# Altium project LoRaWAN-Module-v2.0.PrjPcb
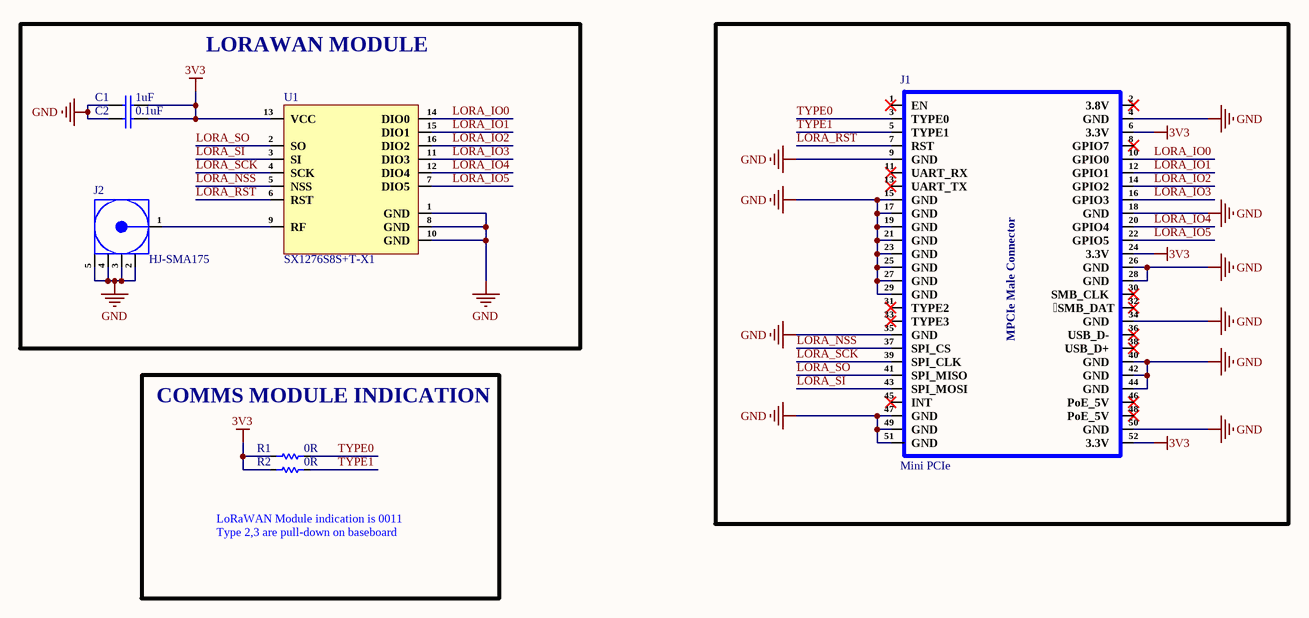
[diagram p0: LoRaWAN-Sheet.SchDoc]
1 sheet, 7 parts. Net scope: global (net labels, ports and power ports of the same name join across sheets).
Board file: LoRaWAN_v2.0.PcbDoc

## Sheet LoRaWAN-Sheet.SchDoc
size A4; SheetNumber: 1; SheetTotal: 1

### Parts
C1  1uF  [Cap-0603]
C2  0.1uF  [Cap-0603]
J1  Mini PCIe  [Mini PCIE Pad]
J2  HJ-SMA175  [HJ-SMA175]
R1  0R  [Res-0603]
R2  0R  [Res-0603]
U1  SX1276S8S+T-X1  [SX1276S8S+T-X1]

### Blocks framed on the sheet
LORAWAN MODULE: C1 C2 J2 U1
COMMS MODULE INDICATION: R1 R2

### Nets
3V3: C1.2 C2.1 J1.6(3.3V) J1.24(3.3V) J1.52(3.3V) R1.1 R2.1 U1.13(VCC)
GND: C1.1 C2.2 J1.4(GND) J1.9(GND) J1.15(GND) J1.17(GND) J1.18(GND) J1.19(GND) J1.21(GND) J1.23(GND) J1.25(GND) J1.26(GND) J1.27(GND) J1.28(GND) J1.29(GND) J1.34(GND) J1.35(GND) J1.40(GND) J1.42(GND) J1.44(GND) J1.47(GND) J1.49(GND) J1.50(GND) J1.51(GND) J2.2(GND) J2.3(GND) J2.4(GND) J2.5(GND) U1.1(GND) U1.8(GND) U1.10(GND)
LORA_IO0: J1.10(GPIO0) U1.14(DIO0)
LORA_IO1: J1.12(GPIO1) U1.15(DIO1)
LORA_IO2: J1.14(GPIO2) U1.16(DIO2)
LORA_IO3: J1.16(GPIO3) U1.11(DIO3)
LORA_IO4: J1.20(GPIO4) U1.12(DIO4)
LORA_IO5: J1.22(GPIO5) U1.7(DIO5)
LORA_NSS: J1.37(SPI_CS) U1.5(NSS)
LORA_RST: J1.7(RST) U1.6(RST)
LORA_SCK: J1.39(SPI_CLK) U1.4(SCK)
LORA_SI: J1.43(SPI_MOSI) U1.3(SI)
LORA_SO: J1.41(SPI_MISO) U1.2(SO)
TYPE0: J1.3(TYPE0) R1.2
TYPE1: J1.5(TYPE1) R2.2
NetJ2_1: J2.1(Signal) U1.9(RF)

Not connected (* = marked no-connect by the designer): J1 1(EN)* 2(3.8V)* 8(GPIO7)* 11(UART_RX)* 13(UART_TX)* 30(SMB_CLK)* 31(TYPE2)* 32(SMB_DAT)* 33(TYPE3)* 36(USB_D-)* 38(USB_D+)* 45(INT)* 46(PoE_5V)* 48(PoE_5V)*

### Notes on the sheet
- LoRaWAN Module indication is 0011
- Type 2,3 are pull-down on baseboard
- File:
- Title:
- Date:
- Page
- Num:
- Total:
- Drawn By: Huzaifa Ali
- (in symbol Mini PCIe) MPCIe Male Connector

### Library data of the parts
C1 = CC0603KRX5R8BB105: CAP CER 1UF 25V X5R 0603; Manufacturer: Yageo; Tolerance: 10%; Supplier 1: Digi-Key; Manufacturer Part Number: CC0603KRX5R8BB105; RoHS: Yes; Category: Ceramic Capacitors; Stock 1: 919939; Pricing 1: 1=0.12000, 10=0.08400, 50=0.04760, 100=0.03940, 500=0.02764, 1000=0.02288 (USD); Mount: Surface Mount; Case/Package: 0603; Number of Pins: 2; Case Code (Metric): 1608; Case Code (Imperial): 0603; Min Operating Temperature: -55°C; Max Operating Temperature: 85°C; Capacitance: 1uF; Dielectric: X5R; Package Quantity: 1; Voltage Rating: 25V; Packaging: Tape and Reel; Termination: SMD/SMT; Voltage Rating (DC): 25V; Series: CC; Construction: Flat; Length: 1.6mm; Width: 0.031inch; Height: 0.8mm; Thickness: 0.035inch; Depth: 0.8mm; Radiation Hardening: No; REACH SVHC: No SVHC; Lead Free: Lead Free; Halogen Free: Halogen Free; RoHS Compliant: Yes; ComponentLink1URL: https://datasheet.ciiva.com/176/mlccorderingcode-176785.pdf?src-supplier=Digi-Key; ComponentLink1Description: https://datasheet.ciiva.com/176/mlccorderingcode-176785.pdf?src-supplier=Digi-Key; ComponentLink2URL: https://datasheet.ciiva.com/176/mlccorderingcode-176786.pdf?src-supplier=Digi-Key; ComponentLink2Description: https://datasheet.ciiva.com/176/mlccorderingcode-176786.pdf?src-supplier=Digi-Key; ComponentLink3URL: https://datasheet.ciiva.com/176/mlccorderingcode-176787.pdf?src-supplier=Digi-Key; ComponentLink3Description: https://datasheet.ciiva.com/176/mlccorderingcode-176787.pdf?src-supplier=Digi-Key; ComponentLink4URL: https://datasheet.ciiva.com/17436/upy-gphc-x5r-4v-to-50v-12-17436952.pdf?src-supplier=Avnet+Europe; ComponentLink4Description: https://datasheet.ciiva.com/17436/upy-gphc-x5r-4v-to-50v-12-17436952.pdf?src-supplier=Avnet+Europe; ComponentLink5URL: https://datasheet.ciiva.com/7978/1525783-7978171.pdf?src-supplier=Element14; ComponentLink5Description: https://datasheet.ciiva.com/7978/1525783-7978171.pdf?src-supplier=Element14; ComponentLink6URL: https://datasheet.ciiva.com/11586/upy-gphc-x5r-4v-to-50v-12-11586318.pdf?src-supplier=Avnet; ComponentLink6Description: https://datasheet.ciiva.com/11586/upy-gphc-x5r-4v-to-50v-12-11586318.pdf?src-supplier=Avnet; Supplier Part Number 1: 311-1445-1-ND; LCSC Part Number: C14664
C2 = CC0603KRX5R9BB104: CAP CER 0.1UF 50V X5R 0603; Manufacturer: Yageo; Capacitance: 100nF; Tolerance: 10%; Item Type: Capacitor; Supplier 1: Digi-Key; Manufacturer Part Number: CC0603KRX5R9BB104; RoHS: Yes; Category: Ceramic Capacitors; Stock 1: 152253; Pricing 1: 1=0.10000, 10=0.05200, 50=0.02820, 100=0.02310, 500=0.01648, 1000=0.01294 (USD); Mount: Surface Mount; Case/Package: 0603; Case Code (Imperial): 0603; Case Code (Metric): 1608; Weight: 7.1E-05oz; Min Operating Temperature: -55°C; Max Operating Temperature: 85°C; Packaging: Tape and Reel; Voltage Rating: 50V; Dielectric: X5R; Termination: SMD/SMT; Voltage Rating (DC): 50V; Package Quantity: 4000; Length: 0.063inch; Width: 0.031inch; Thickness: 0.035inch; Lead Free: Lead Free; Halogen Free: Halogen Free; ComponentLink1URL: http://www.mouser.com/ds/2/447/Yageo_UPY-GP_NP0_16V-to-50V_9-358835.pdf?src-supplier=Mouser; ComponentLink1Description: http://www.mouser.com/ds/2/447/Yageo_UPY-GP_NP0_16V-to-50V_9-358835.pdf?src-supplier=Mouser; ComponentLink2URL: https://www.yageo.com/upload/media/product/productsearch/datasheet/mlcc/UPY-GPHC_X5R_4V-to-50V_26.pdf?src-supplier=Digi-Key; ComponentLink2Description: https://www.yageo.com/upload/media/product/productsearch/datasheet/mlcc/UPY-GPHC_X5R_4V-to-50V_26.pdf?src-supplier=Digi-Key; ComponentLink3URL: http://www.yageo.com/exep/pages/download/literatures/ProductSelectionGuide%202014_Final_2.pdf?src-supplier=Digi-Key; ComponentLink3Description: http://www.yageo.com/exep/pages/download/literatures/ProductSelectionGuide%202014_Final_2.pdf?src-supplier=Digi-Key; Supplier Part Number 1: 311-4046-1-ND; LCSC Part Number: C110022
J1 = Mini PCIe: PCI Express Mini Card (Mini PCIe)
J2 = HJ-SMA175: 1 Inner bore SMA Board Edge Bend 11mm 5.35mm Plugin RF Connectors / Coaxial Connectors ROHS; Manufacturer: HJ Tech; Item Type: SMA Connector; Manufacturer Part Number: HJ-SMA175; Package: Plugin; LCSC Part Number: C1509213; ComponentLink1Description: LCSC; ComponentLink1URL: https://www.lcsc.com/product-detail/RF-Connectors-Coaxial-Connectors_HJ-Tech-HJ-SMA175_C1509213.html
R1 R2 = RC0603FR-070RL: RES SMD 0R, 1%, 0.1W, 0603; Manufacturer: Yageo; Item Type: Resistor; Manufacturer Part Number: RC0603FR-070RL; Package: 0603; LCSC Part Number: C100044; ComponentLink9Description: LCSC; ComponentLink9URL: https://www.lcsc.com/product-detail/Chip-Resistor-Surface-Mount_YAGEO-RC0603FR-070RL_C100044.html
U1 = SX1276S8S+T-X1: SMD,16x16mm LoRa Modules ROHS; Manufacturer: Vollgo; Item Type: Module; Manufacturer Part Number: SX1276S8S+T-X1; Package: SMD,16x16mm; LCSC Part Number: C718834; ComponentLink1Description: LCSC; ComponentLink1URL: https://www.lcsc.com/product-detail/LoRa-Modules_Vollgo-SX1276S8S-T-X1_C718834.html